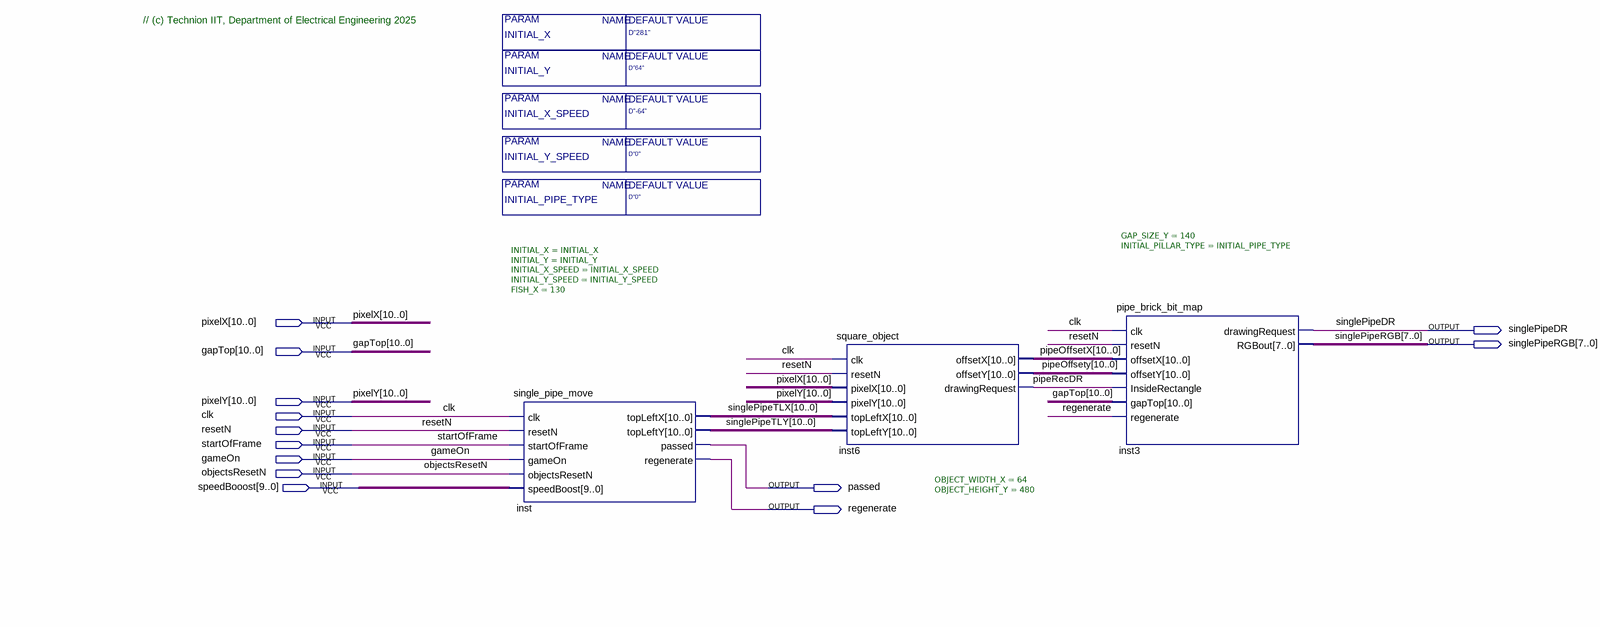
[diagram p0: schematic sheet]
// Quartus schematic Pipes_Block_T.bdf as structural Verilog: 3 symbols, 13 pins
module Pipes_Block_T #(parameter INITIAL_Y = "D\"64\"", parameter INITIAL_X_SPEED = "D\"-64\"", parameter INITIAL_Y_SPEED = "D\"0\"", parameter INITIAL_X = "D\"281\"", parameter INITIAL_PIPE_TYPE = "D\"0\"") (
  input  [10:0] pixelX,
  input  [10:0] gapTop,
  input  [10:0] pixelY,
  input  clk,
  input  resetN,
  input  startOfFrame,
  input  gameOn,
  input  objectsResetN,
  input  [9:0] speedBooost,
  output singlePipeDR,
  output [7:0] singlePipeRGB,
  output passed,
  output regenerate
);

  wire pipeRecDR;
  wire [10:0] pipeOffsetX, pipeOffsety, singlePipeTLX, singlePipeTLY;

  single_pipe_move #(.INITIAL_X(INITIAL_X), .INITIAL_Y(INITIAL_Y), .INITIAL_X_SPEED(INITIAL_X_SPEED), .INITIAL_Y_SPEED(INITIAL_Y_SPEED), .FISH_X(130)) inst (
    .clk(clk), .resetN(resetN), .startOfFrame(startOfFrame), .gameOn(gameOn), .objectsResetN(objectsResetN),
    .speedBoost(speedBooost), .topLeftX(singlePipeTLX), .topLeftY(singlePipeTLY), .passed(passed),
    .regenerate(regenerate));
  square_object #(.OBJECT_WIDTH_X(64), .OBJECT_HEIGHT_Y(480)) inst6 (
    .clk(clk), .resetN(resetN), .pixelX(pixelX), .pixelY(pixelY), .topLeftX(singlePipeTLX),
    .topLeftY(singlePipeTLY), .offsetX(pipeOffsetX), .offsetY(pipeOffsety), .drawingRequest(pipeRecDR));
  pipe_brick_bit_map #(.GAP_SIZE_Y(140), .INITIAL_PILLAR_TYPE(INITIAL_PIPE_TYPE)) inst3 (
    .clk(clk), .resetN(resetN), .offsetX(pipeOffsetX), .offsetY(pipeOffsety), .InsideRectangle(pipeRecDR),
    .gapTop(gapTop), .regenerate(regenerate), .drawingRequest(singlePipeDR), .RGBout(singlePipeRGB));

  // Notes on the sheet:
  //   // (c) Technion IIT, Department of Electrical Engineering 2025
endmodule
